# Altium schematic sheet Peripherals.SchDoc
size A4; SheetNumber: 8; SheetTotal: 8
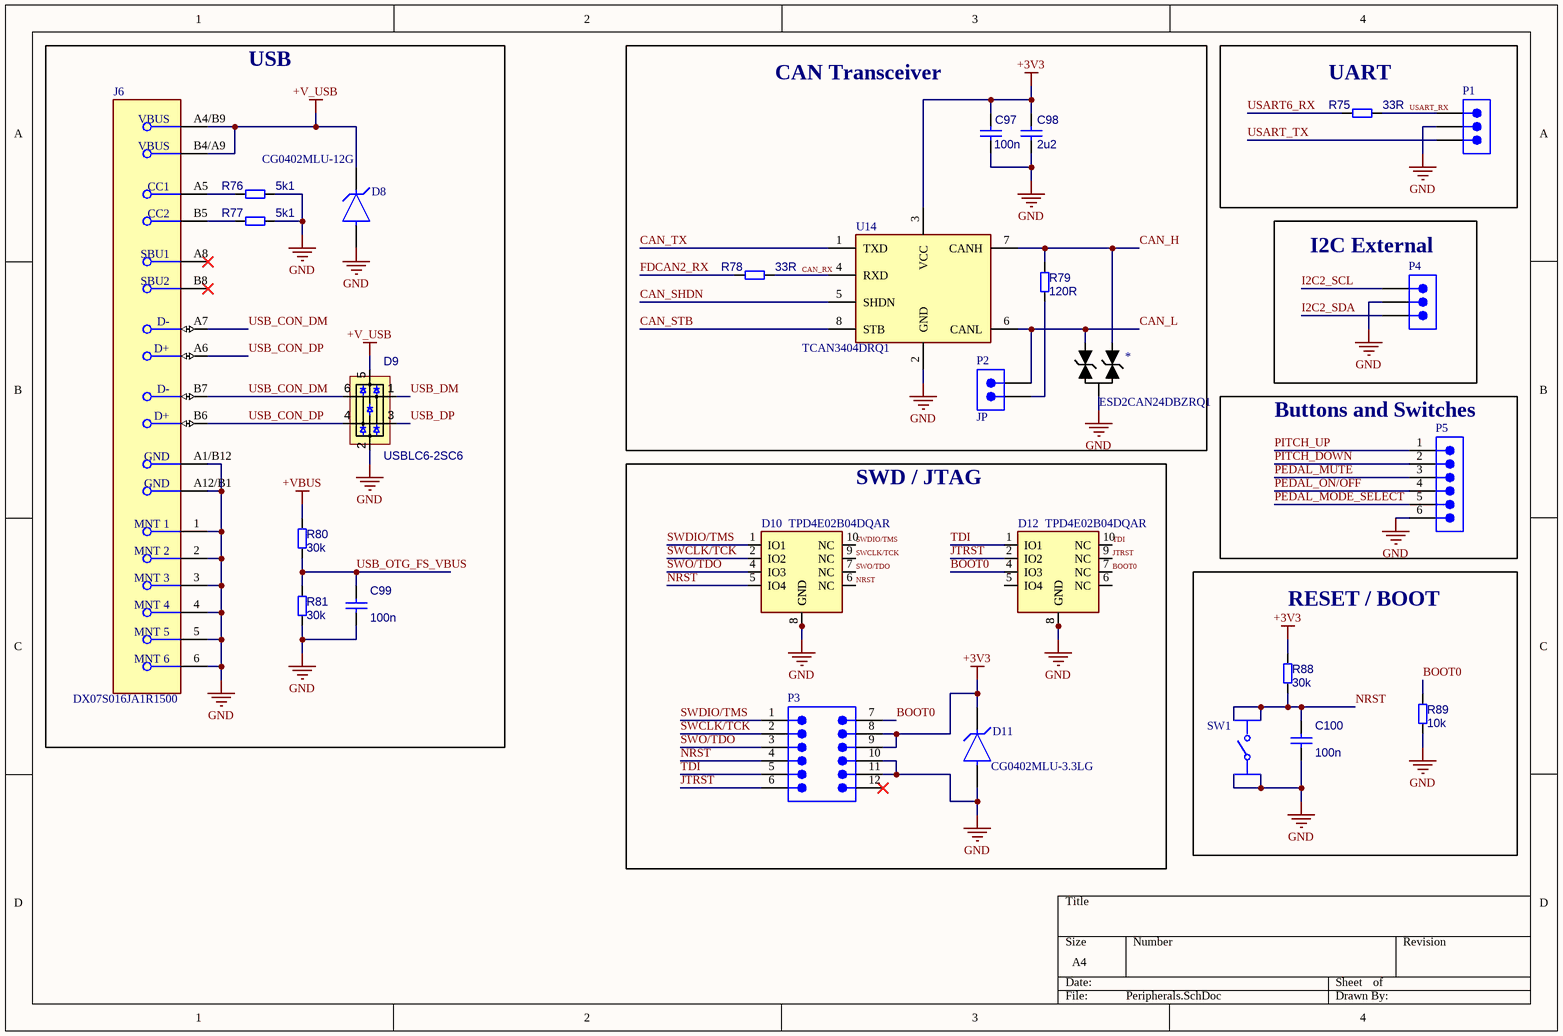
[diagram p0: Peripherals.SchDoc]

## Parts
*  ESD2CAN24DBZRQ1  [SOT-23_ESD2CAN24DBZRQ1]
C97  100n  [CAPC1005X50N_0402]
C98  2u2  [C_0402]
C99  100n  [CAPC1005X50N_0402]
C100  100n  [CAPC1005X50N_0402]
D8  CG0402MLU-12G  [FP-1610-MFG]
D9  USBLC6-2SC6  [STM-SOT23-6L_V]
D10  TPD4E02B04DQAR  [FP-DQA0010A-MFG]
D11  CG0402MLU-3.3LG  [FP-1610-MFG]
D12  TPD4E02B04DQAR  [FP-DQA0010A-MFG]
J6  DX07S016JA1R1500  [FP-DX07S016JA1R1500-MFG]
P1  Male Pin Header 1x3 2.54mm  [Copy of Copy of Copy of Copy of Copy of 3M-2340-6111TG_V]  (value not drawn)
P2  JP  [Copy of Copy of Copy of Copy of 3M-2340-6111TG_V]
P3  Male Pin Header 2x6 2.54mm  [Copy of Copy of Copy of 3M-2340-6111TG_V]  (value not drawn)
P4  Male Pin Header 1x3 2.54mm  [Copy of Copy of Copy of Copy of Copy of 3M-2340-6111TG_V]  (value not drawn)
P5  Male Pin Header 1x6 2.54mm  [Copy of Copy of Copy of Copy of 3M-2340-6111TG_V]  (value not drawn)
R75  33R  [R_0402]
R76  5k1  [R_0603]
R77  5k1  [R_0603]
R78  33R  [R_0402]
R79  120R  [R_0402]
R80  30k  [R_0603]
R81  30k  [R_0603]
R88  30k  [R_0603]
R89  10k  [R_0603]
SW1  1301.9316.24  [FP-1301_9316_24-MFG]  (value not drawn)
U14  TCAN3404DRQ1  [SOIC-8_TCAN3404DRQ1]

## Blocks framed on the sheet
USB: C99 D8 D9 J6 R76 R77 R80 R81
CAN Transceiver: * C97 C98 P2 R78 R79 U14
UART: P1 R75
I2C External: P4
Buttons and Switches: P5
SWD / JTAG: D10-D12 P3
RESET / BOOT: C100 R88 R89 SW1

## Nets
+3V3: C97.1 C98.1 D11.1(C) P3.8 P3.9 R88.1 U14.3(VCC)
+V_USB: D8.1(C) D9.5(K) J6.A4/B9(VBUS) J6.B4/A9(VBUS)
+VBUS: R80.1
GND: *.3(GND) C97.2 C98.2 C99.2 C100.2 D8.2(A) D9.2(A) D10.3(GND) D10.8(GND) D11.2(A) D12.3(GND) D12.8(GND) J6.1(MNT_1) J6.2(MNT_2) J6.3(MNT_3) J6.4(MNT_4) J6.5(MNT_5) J6.6(MNT_6) J6.A1/B12(GND) J6.A12/B1(GND) P1.2 P3.10 P3.11 P4.2 P5.6 R76.2 R77.2 R81.2 R89.2 SW1.3 SW1.4 U14.2(GND)
BOOT0: D12.4(IO3) D12.7(NC) P3.7 R89.1
CAN_H: *.1(IO) R79.2 U14.7(CANH)
CAN_L: *.2(IO) P2.1 U14.6(CANL)
CAN_RX: R78.2 U14.4(RXD)
CAN_SHDN: U14.5(SHDN)
CAN_STB: U14.8(STB)
CAN_TX: U14.1(TXD)
FDCAN2_RX: R78.1
I2C2_SCL: P4.1
I2C2_SDA: P4.3
JTRST: D12.2(IO2) D12.9(NC) P3.6
NRST: C100.1 D10.5(IO4) D10.6(NC) P3.4 R88.2 SW1.1 SW1.2
PEDAL_MODE_SELECT: P5.5
PEDAL_MUTE: P5.3
PEDAL_ON/OFF: P5.4
PITCH_DOWN: P5.2
PITCH_UP: P5.1
SWCLK/TCK: D10.2(IO2) D10.9(NC) P3.2
SWDIO/TMS: D10.1(IO1) D10.10(NC) P3.1
SWO/TDO: D10.4(IO3) D10.7(NC) P3.3
TDI: D12.1(IO1) D12.10(NC) P3.5
USART6_RX: R75.1
USART_RX: P1.1 R75.2
USART_TX: P1.3
USB_CON_DM: D9.6(K) J6.A7(D-) J6.B7(D-)
USB_CON_DP: D9.4(A) J6.A6(D+) J6.B6(D+)
USB_DM: D9.1(K)
USB_DP: D9.3(A)
USB_OTG_FS_VBUS: C99.1 R80.2 R81.1
NetJ6_A5: J6.A5(CC1) R76.1
NetJ6_B5: J6.B5(CC2) R77.1
NetP2_2: P2.2 R79.1

Not connected (* = marked no-connect by the designer): D12 5(IO4) 6(NC); J6 A8(SBU1)* B8(SBU2)*; P3 12*

## Library data of the parts
* = CMP-004-00034-1: Automotive, dual, 3-pF, ±24-V, ±30-kV ESD protection diode for in-vehicle networks 3-SOT-23 -55 to 150; Manufacturer Lifecycle Status: ACTIVE; Interface: CAN; Lifecycle Status: Production; Length: 2.92mm; Width: 1.3mm; Case/Package: SOT-23; Pins: 3; Height: 1.22mm; Thickness: 1mm; RoHS: Compliant
C97 C99 C100 = CMP-001-00084-2: MLCC 0402 50V / Samsung CL05B104KB54PNC
C98 = CMP-001-00085-2: Capacitor SMD Tantalum 0603 50V / Kyocera AVX F981C225MMA
D8 = CMP-12225-000013-1: Bourns CG0402MLU-12G / ESD Protection Device, 25 V, 0402 [1005 Metric], 2 Pins, 12 V, 0.05 pF, ChipGuard MLU; Manufacturer: STMicroelectronics; Manufacturer Part Number: ESDA7P60-1U1M; Number Of Channels: 1; Standoff Height: 0mm; Breakdown Voltage: 6.4V; Direction: Unidirectional; Clamping Voltage: 10.2V; Peak Pulse Power: 700W; Peak Pulse Current: 60A; Reverse Standoff Voltage: 5V; Max Junction Temp: +150°C; ComponentLink2Description: Datasheet; Temperature Range Low: -55°C; Package: 1610; Lead Free: Yes; Temperature Range High: +150°C; Temperature: -55°C to +150°C; Device Class L2: TVS Diodes; Category: Diode; Device Class L1: Circuit Protection; Digikey Description: TVS DIODE 5V 11.6V 1610; ComponentLink2URL: http://www.st.com/content/ccc/resource/technical/document/datasheet/44/e9/26/44/42/ee/4f/e5/DM00139972.pdf/files/DM00139972.pdf/jcr:content/translations/en.DM00139972.pdf; RoHS: TRUE; Octopart: https://octopart.com/esda7p60-1u1m-stmicroelectronics-52112702; Height: 0.65mm; Device Class L3: unset; Automotive: No
D9 = CMP-004-00031-1: STMicroelectronics Uni-Directional TVS Diode Array, 17V Vcl Max, SMD, SOT-23, 6V Vbr Min; Forward Voltage: 1.1V; Case/Package: SOT-23; Mounting Technology: Surface Mount; Min Operating Temperature: -40°C; Max Operating Temperature: 125°C; Pins: 6
D10 D12 = CMP-004-00032-3: Tvs Diodes & Esd Suppressors; TPD4E02B04DQAR; Texas Instruments; 3.6 V; 8.8 V; 5.5 V; 6.4 V; Max Operating Temperature: 125°C; Min Operating Temperature: -40°C; Mounting Technology: Surface Mount; Pins: 10
D11 = CMP-12225-000013-1: Bourns CG0402MLU-3.3LG / ESD Protection Device, 25 V, 0402 [1005 Metric], 2 Pins, 12 V, 0.05 pF, ChipGuard MLU; Manufacturer: STMicroelectronics; Manufacturer Part Number: ESDA7P60-1U1M; Number Of Channels: 1; Standoff Height: 0mm; Breakdown Voltage: 6.4V; Direction: Unidirectional; Clamping Voltage: 10.2V; Peak Pulse Power: 700W; Peak Pulse Current: 60A; Reverse Standoff Voltage: 5V; Max Junction Temp: +150°C; ComponentLink2Description: Datasheet; Temperature Range Low: -55°C; Package: 1610; Lead Free: Yes; Temperature Range High: +150°C; Temperature: -55°C to +150°C; Device Class L2: TVS Diodes; Category: Diode; Device Class L1: Circuit Protection; Digikey Description: TVS DIODE 5V 11.6V 1610; ComponentLink2URL: http://www.st.com/content/ccc/resource/technical/document/datasheet/44/e9/26/44/42/ee/4f/e5/DM00139972.pdf/files/DM00139972.pdf/jcr:content/translations/en.DM00139972.pdf; RoHS: TRUE; Octopart: https://octopart.com/esda7p60-1u1m-stmicroelectronics-52112702; Height: 0.65mm; Device Class L3: unset; Automotive: No
J6 = CMP-19038-000003-1: CONN RCP USB2.0 TYP C 24P SMD RA
P1 P4 = CMP-002-00080-1: Male Header, Pitch 2.54 mm, 1x3 Position, Height 8.636 mm, Tail Length 3.05 mm, -55 to 105 degC, RoHS, Bulk; Manufacturer: 3M; Rows: 1; Current Rating: 3A; Mounting Technology: TH; Contact Plating: Gold; Packaging: Bulk; Lead Pitch: 0.1inch; Case/Package: 2340-6111TG; Contact Material: Copper; Pins: 40; Package Description: Male Header, Pitch 2.54 mm, 1 x 40 Position, Height 8.636 mm, Tail Length 3.05 mm; RoHS Compliant: True; Connector Type: Header; Manufacturer URL: http://www.3m.com/; Contact Finish: Gold; Max Operating Temperature: 105°C; Min Operating Temperature: -55°C; Max Current Rating: 3A; Gender: Male; Package Quantity: 200; Colour: Black; Package Reference: 2340-6111TG; Datasheet URL: https://datasheet.ciiva.com/5161/ts0766-242217-5161112.pdf; Datasheet Version: Aug-08
P2 = CMP-002-00078-1: Male Header, Pitch 2.54 mm, 2x 1 Position, Height 8.636 mm, Tail Length 3.05 mm, -55 to 105 degC, RoHS, Bulk; Manufacturer: 3M; Max Current Rating: 3A; Rows: 1; Gender: Male; Max Operating Temperature: 105°C; Contact Finish: Gold; Datasheet URL: https://datasheet.ciiva.com/5161/ts0766-242217-5161112.pdf; Pins: 40; Package Description: Male Header, Pitch 2.54 mm, 1 x 40 Position, Height 8.636 mm, Tail Length 3.05 mm; Contact Material: Copper; Package Reference: 2340-6111TG; Package Quantity: 200; Current Rating: 3A; Datasheet Version: Aug-08; Min Operating Temperature: -55°C; Connector Type: Header; Contact Plating: Gold; Case/Package: 2340-6111TG; Packaging: Bulk; RoHS Compliant: True; Manufacturer URL: http://www.3m.com/; Lead Pitch: 0.1inch; Colour: Black; Mounting Technology: TH
P3 = CMP-002-00077-1: Male Header, Pitch 2.54 mm, 2x6 Position, Height 8.636 mm, Tail Length 3.05 mm, -55 to 105 degC, RoHS, Bulk; Manufacturer: 3M; Current Rating: 3A; Rows: 1; Pins: 40; Case/Package: 2340-6111TG; Package Description: Male Header, Pitch 2.54 mm, 1 x 40 Position, Height 8.636 mm, Tail Length 3.05 mm; Mounting Technology: TH; Lead Pitch: 0.1inch; Contact Finish: Gold; Connector Type: Header; Manufacturer URL: http://www.3m.com/; Gender: Male; Min Operating Temperature: -55°C; Datasheet Version: Aug-08; Contact Plating: Gold; Packaging: Bulk; Package Reference: 2340-6111TG; Colour: Black; Max Current Rating: 3A; RoHS Compliant: True; Max Operating Temperature: 105°C; Package Quantity: 200; Datasheet URL: https://datasheet.ciiva.com/5161/ts0766-242217-5161112.pdf; Contact Material: Copper
P5 = CMP-002-00079-1: Male Header, Pitch 2.54 mm, 1x6 Position, Height 8.636 mm, Tail Length 3.05 mm, -55 to 105 degC, RoHS, Bulk; Manufacturer: 3M; Max Current Rating: 3A; Rows: 1; Manufacturer URL: http://www.3m.com/; RoHS Compliant: True; Max Operating Temperature: 105°C; Connector Type: Header; Packaging: Bulk; Pins: 40; Current Rating: 3A; Package Reference: 2340-6111TG; Min Operating Temperature: -55°C; Datasheet Version: Aug-08; Colour: Black; Package Description: Male Header, Pitch 2.54 mm, 1 x 40 Position, Height 8.636 mm, Tail Length 3.05 mm; Contact Finish: Gold; Contact Material: Copper; Case/Package: 2340-6111TG; Contact Plating: Gold; Datasheet URL: https://datasheet.ciiva.com/5161/ts0766-242217-5161112.pdf; Gender: Male; Mounting Technology: TH; Package Quantity: 200; Lead Pitch: 0.1inch
R75 R78 R79 = CMP-009-00178-3: Chip 0402 resistor
R76 R77 = CMP-009-00177-7: Chip THIN FILM 0603 / Viking Tech ARG03FTC5101
R80 R81 R88 R89 = CMP-009-00177-7: Chip resistor 0603
SW1 = CMP-00030-00001-1: Switch Tactile N.O. SPST Round Button Gull Wing 0.05A 12VDC >100000Cycles 1.6N SMD T/R; Max Operating Temperature: 70°C; Case/Package: SMD/SMT; Mounting Technology: Surface Mount; Min Operating Temperature: -20°C
U14 = CMP-015-00010-2: Automotive 3.3V CAN flexible-data-rate (FD) transceiver with shutdown and standby mode 8-SOIC -40 to 150; Manufacturer Lifecycle Status: ACTIVE; Length: 4.9mm; Width: 3.91mm; Case/Package: SOIC; Pins: 8; RoHS: Compliant; Height: 1.75mm; Thickness: 1.58mm; Lifecycle Status: Production